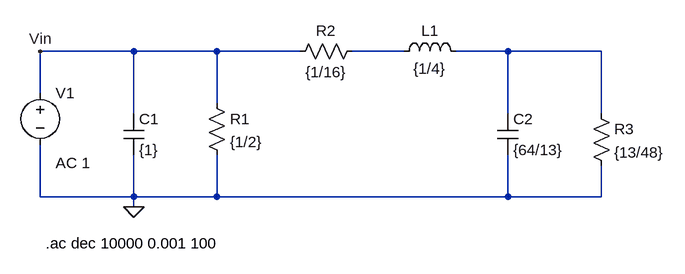
[diagram p0: schematic punto1.asc]
punto1.asc, the LTspice schematic file:
Version 4
SHEET 1 924 680
WIRE 80 48 -64 48
WIRE 208 48 80 48
WIRE 336 48 208 48
WIRE 496 48 416 48
WIRE 656 48 576 48
WIRE 800 48 656 48
WIRE -64 112 -64 48
WIRE 208 128 208 48
WIRE 80 144 80 48
WIRE 656 144 656 48
WIRE 800 144 800 48
WIRE -64 272 -64 192
WIRE 80 272 80 208
WIRE 80 272 -64 272
WIRE 208 272 208 208
WIRE 208 272 80 272
WIRE 656 272 656 208
WIRE 656 272 208 272
WIRE 800 272 800 224
WIRE 800 272 656 272
WIRE 80 288 80 272
FLAG 80 288 0
FLAG -64 48 Vin
SYMBOL voltage -64 96 R0
WINDOW 123 24 124 Left 2
WINDOW 39 0 0 Left 0
SYMATTR InstName V1
SYMATTR Value ""
SYMATTR Value2 AC 1
SYMBOL res 192 112 R0
SYMATTR InstName R1
SYMATTR Value {1/2}
SYMBOL res 432 32 R90
WINDOW 0 0 56 VBottom 2
WINDOW 3 32 56 VTop 2
SYMATTR InstName R2
SYMATTR Value {1/16}
SYMBOL ind 480 64 R270
WINDOW 0 32 56 VTop 2
WINDOW 3 5 56 VBottom 2
SYMATTR InstName L1
SYMATTR Value {1/4}
SYMBOL cap 640 144 R0
SYMATTR InstName C2
SYMATTR Value {64/13}
SYMBOL res 784 128 R0
SYMATTR InstName R3
SYMATTR Value {13/48}
SYMBOL cap 64 144 R0
SYMATTR InstName C1
SYMATTR Value {1}
TEXT -56 344 Left 2 !.ac dec 10000 0.001 100

The netlist it stands for:
* punto1.asc
V1 Vin 0 AC 1
R1 Vin 0 {1/2}
R2 N001 Vin {1/16}
L1 N001 N002 {1/4}
C2 N002 0 {64/13}
R3 N002 0 {13/48}
C1 Vin 0 {1}
.ac dec 10000 0.001 100
.backanno
.end